# Altium schematic sheet 0.main.SchDoc
size A4; Organization: ORGANIZATION; Address1: ADDRESS 1; Address2: ADDRESS 2; Address3: ADDRESS 3; Address4: ADDRESS 4; DocumentNumber: 1; SheetNumber: 1; SheetTotal: 5; ENG_APP_DATE: --/--/--; DSN_APP_DATE: --/--/--; CHK_APP_DATE: --/--/--; Page: Top
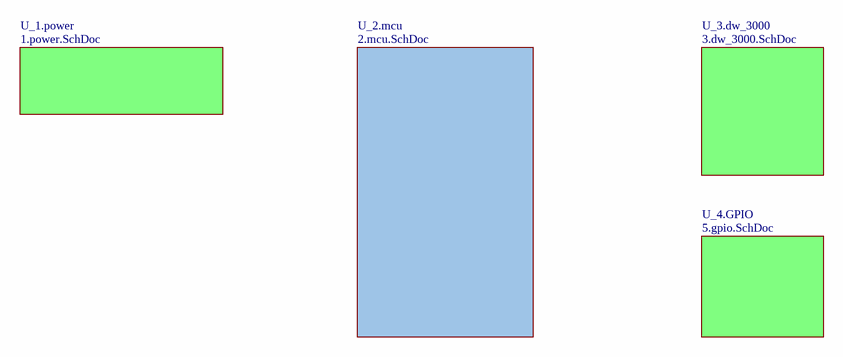
[diagram p0: 0.main.SchDoc]

## Sub-sheets
U_1.power = 1.power.SchDoc: no entries
U_2.mcu = 2.mcu.SchDoc: no entries
U_3.dw_3000 = 3.dw_3000.SchDoc: no entries
U_4.GPIO = 5.gpio.SchDoc: no entries

## Notes on the sheet
- Title :
- Size:
- Date:
- Page :
- A4
- Number:
- Time:
- Revision:
- Sheet
- of
- Sheet Name :
- Drawn By :